# Altium schematic sheet Aquario.SchDoc
size 508 x 193 mm; SheetNumber: 1; SheetTotal: 1
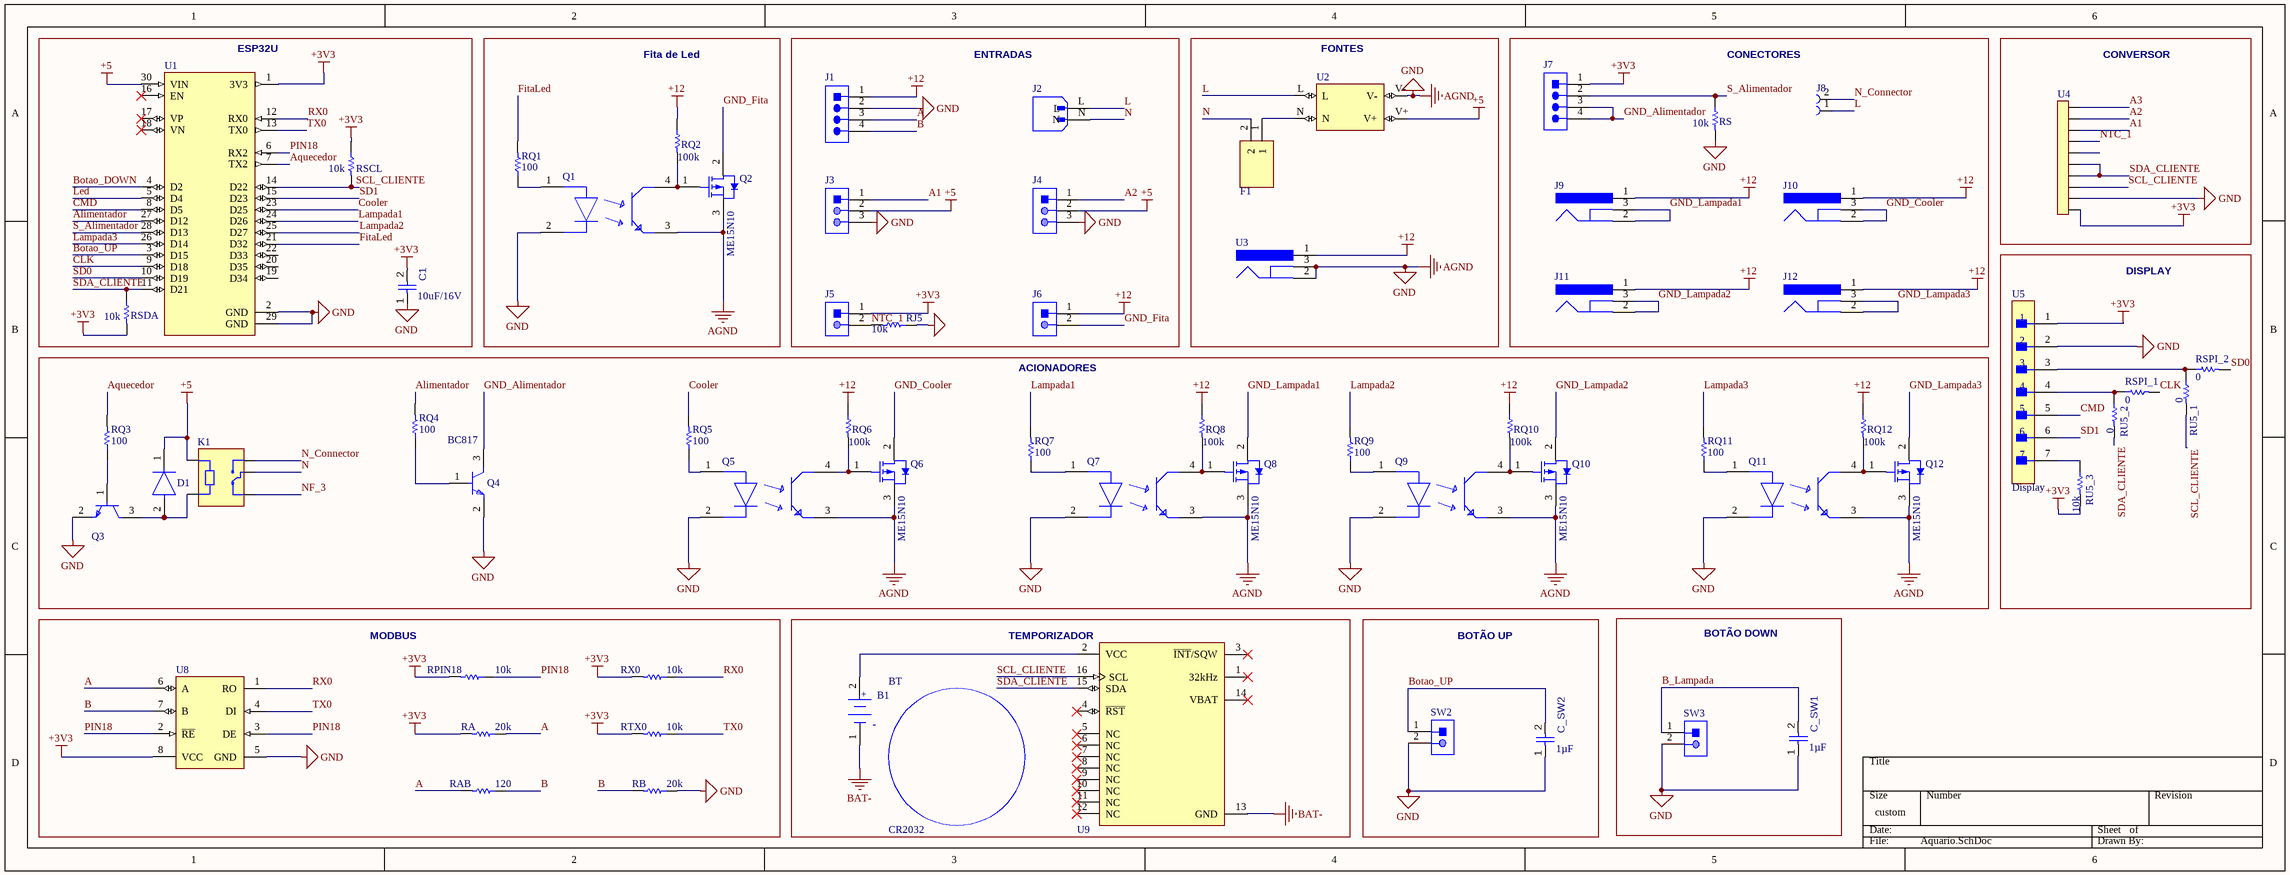
[diagram p0: Aquario.SchDoc]

## Parts
B1  S8421-45R  [FP-S8421-45R-MFG]  (value not drawn)
BT  CR2032  [FP-CR2032-MFG]
C1  10uF/16V  [CAPC2013X145X50ML20T25]
C_SW1  value 1µF  [CAPC2013X145X50ML20T25]  (hidden comment: Capacitor 1 uF +/- 10% 25 V 0805)
C_SW2  value 1µF  [CAPC2013X145X50ML20T25]  (hidden comment: Capacitor 1 uF +/- 10% 25 V 0805)
D1  1N4007 SMD  [FP-1N4007_SMD-IPC_C]  (value not drawn)
F1  0PTF0078P  [0PTF0078P]  (value not drawn)
J1  S4B-XH-A(LF)(SN)  [JST-S4B-XH-A(LF)(SN)_V]  (value not drawn)
J2  RAPC322X  [SWITCHCRAFT_RAPC322X]  (value not drawn)
J3  S3B-XH-A(LF)(SN)  [JST-S3B-XH-A(LF)(SN)_V]  (value not drawn)
J4  S3B-XH-A(LF)(SN)  [JST-S3B-XH-A(LF)(SN)_V]  (value not drawn)
J5  S2B-XH-A(LF)(SN)  [JST-S2B-XH-A(LF)(SN)_V]  (value not drawn)
J6  S2B-XH-A(LF)(SN)  [JST-S2B-XH-A(LF)(SN)_V]  (value not drawn)
J7  S4B-XH-A(LF)(SN)  [JST-S4B-XH-A(LF)(SN)_V]  (value not drawn)
J8  CON2POS  [CON2POS-Footprint-1]  (value not drawn)
J9  PJ-002A  [CUI-PJ-002A_V]  (value not drawn)
J10  PJ-002A  [CUI-PJ-002A_V]  (value not drawn)
J11  PJ-002A  [CUI-PJ-002A_V]  (value not drawn)
J12  PJ-002A  [CUI-PJ-002A_V]  (value not drawn)
K1  SRD-05VDC-SL-C  [RELAY_SRD-05VDC-SL-C]  (value not drawn)
Q1  PC817X4NIP0F  [FP-PC817X4NIP0F-MFG]  (value not drawn)
Q2  ME15N10  [INF-PG-TO252-3-1_L]
Q3  BC817-40,215  [FP-SOT23-MFG]  (value not drawn)
Q4  BC817  [FP-SOT23-MFG]
Q5  PC817X4NIP0F  [FP-PC817X4NIP0F-MFG]  (value not drawn)
Q6  ME15N10  [INF-PG-TO252-3-1_L]
Q7  PC817X4NIP0F  [FP-PC817X4NIP0F-MFG]  (value not drawn)
Q8  ME15N10  [INF-PG-TO252-3-1_L]
Q9  PC817X4NIP0F  [FP-PC817X4NIP0F-MFG]  (value not drawn)
Q10  ME15N10  [INF-PG-TO252-3-1_L]
Q11  PC817X4NIP0F  [FP-PC817X4NIP0F-MFG]  (value not drawn)
Q12  ME15N10  [INF-PG-TO252-3-1_L]
RA  20k  [RESC2013X50X30LL20T20]
RAB  120  [RESC2013X50X30LL20T20]
RB  20k  [RESC2013X50X30LL20T20]
RJ5  10k  [RESC2013X50X30LL20T20]
RPIN18  10k  [RESC2013X50X30LL20T20]
RQ1  100  [RESC2013X50X30LL20T20]
RQ2  100k  [RESC2013X50X30LL20T20]
RQ3  100  [RESC2013X50X30LL20T20]
RQ4  100  [RESC2013X50X30LL20T20]
RQ5  100  [RESC2013X50X30LL20T20]
RQ6  100k  [RESC2013X50X30LL20T20]
RQ7  100  [RESC2013X50X30LL20T20]
RQ8  100k  [RESC2013X50X30LL20T20]
RQ9  100  [RESC2013X50X30LL20T20]
RQ10  100k  [RESC2013X50X30LL20T20]
RQ11  100  [RESC2013X50X30LL20T20]
RQ12  100k  [RESC2013X50X30LL20T20]
RS  10k  [RESC2013X50X30LL20T20]
RSCL  10k  [RESC2013X50X30LL20T20]
RSDA  10k  [RESC2013X50X30LL20T20]
RSPI_1  0  [RESC2013X50X30LL20T20]
RSPI_2  0  [RESC2013X50X30LL20T20]
RTX0  10k  [RESC2013X50X30LL20T20]
RU5_1  0  [RESC2013X50X30LL20T20]
RU5_2  0  [RESC2013X50X30LL20T20]
RU5_3  10k  [RESC2013X50X30LL20T20]
RX0  10k  [RESC2013X50X30LL20T20]
SW2  S2B-XH-A(LF)(SN)  [JST-S2B-XH-A(LF)(SN)_V]  (value not drawn)
SW3  S2B-XH-A(LF)(SN)  [JST-S2B-XH-A(LF)(SN)_V]  (value not drawn)
U1  ESP32-DEVKIT-V1  [MODULE_ESP32_DEVKIT_V1]  (value not drawn)
U2  HLK-5VFonte  [HLK-5VFonte-Footprint-1]  (value not drawn)
U3  PJ-002A  [CUI-PJ-002A_V]  (value not drawn)
U4  ADS1115  [CON10]  (value not drawn)
U5  Display  [FP-B7B-XH-A_LF_SN-MFG]
U8  MAX485CSA+  [MAXM-MAX485CSA+-8_M]  (value not drawn)
U9  DS3231SN#T&R  [FP-W16-H2-MFG]  (value not drawn)

## Blocks framed on the sheet
ESP32U: C1 RSCL RSDA U1
Fita de Led: Q1 Q2 RQ1 RQ2
ENTRADAS: J1-J6 RJ5
FONTES: F1 U2 U3
CONECTORES: J7-J12 RS
CONVERSOR: U4
DISPLAY: RSPI_1 RSPI_2 RU5_1-RU5_3 U5
ACIONADORES: D1 K1 Q3-Q12 RQ3-RQ12
MODBUS: RA RAB RB RPIN18 RTX0 RX0 U8
TEMPORIZADOR: B1 BT U9
BOTÃO UP: C_SW2 SW2
BOTÃO DOWN: C_SW1 SW3

## Nets
+3V3: C1.2 J5.1 J7.1 RA.2 RPIN18.2 RSCL.1 RSDA.2 RTX0.2 RU5_3.2 RX0.2 U1.1(3V3) U4.10 U5.1 U8.8(VCC)
+5: D1.1(C) J3.2 J4.2 K1.A1 U1.30(VIN) U2.V+
+12: J1.1 J6.1 J9.1 J10.1 J11.1 J12.1 RQ2.1 RQ6.1 RQ8.1 RQ10.1 RQ12.1 U3.1
AGND: C1.1 C_SW1.1 C_SW2.1 J1.2 J3.3 J4.3 Q1.2(C) Q1.3(E) Q2.3(SOURCE) Q3.2(E) Q4.2(E) Q5.2(C) Q5.3(E) Q6.3(SOURCE) Q7.2(C) Q7.3(E) Q8.3(SOURCE) Q9.2(C) Q9.3(E) Q10.3(SOURCE) Q11.2(C) Q11.3(E) Q12.3(SOURCE) RB.1 RJ5.1 RS.2 SW2.2 SW3.2 U1.2(GND) U1.29(GND) U2.V- U3.2 U3.3 U4.9 U5.2 U8.5(GND)  [also labelled GND]
BAT-: B1.1(C) U9.13(GND)
A: J1.3 RA.1 RAB.2 U8.6(A)
A1: J3.1 U4.3
A2: J4.1 U4.2
A3: U4.1
Alimentador: RQ4.2 U1.27(D12)
Aquecedor: RQ3.2 U1.7(TX2)
B: J1.4 RAB.1 RB.2 U8.7(B)
B_Lampada: C_SW1.2 SW3.1
Botao_DOWN: U1.4(D2)
Botao_UP: C_SW2.2 SW2.1 U1.3(D15)
CLK: RSPI_1.2 U1.9(D18)
CMD: U1.8(D5) U5.5
Cooler: RQ5.2 U1.23(D25)
FitaLed: RQ1.2 U1.21(D32)
GND_Alimentador: J7.3 J7.4 Q4.3(C)
GND_Cooler: J10.2 J10.3 Q6.2(DRAIN)
GND_Fita: J6.2 Q2.2(DRAIN)
GND_Lampada1: J9.2 J9.3 Q8.2(DRAIN)
GND_Lampada2: J11.2 J11.3 Q10.2(DRAIN)
GND_Lampada3: J12.2 J12.3 Q12.2(DRAIN)
L: J2.L J8.1 U2.L
Lampada1: RQ7.2 U1.24(D26)
Lampada2: RQ9.2 U1.25(D27)
Lampada3: RQ11.2 U1.26(D14)
Led: U1.5(D4)
N: F1.2 J2.N K1.COM
N_Connector: J8.2 K1.NO
NF_3: K1.NC
NTC_1: J5.2 RJ5.2 U4.4
PIN18: RPIN18.1 U1.6(RX2) U8.2(~{RE}) U8.3(DE)
RX0: RX0.1 U1.12(RX0) U8.1(RO)
S_Alimentador: J7.2 RS.1 U1.28(D13)
SCL_CLIENTE: RSCL.2 RU5_1.2 U1.14(D22) U4.8 U9.16(SCL)
SD0: RSPI_2.2 U1.10(D19)
SD1: U1.15(D23) U5.6
SDA_CLIENTE: RSDA.1 RU5_2.2 U1.11(D21) U4.6 U4.7 U9.15(SDA)
TX0: RTX0.1 U1.13(TX0) U8.4(DI)
NetB1_2: B1.2(A) U9.2(VCC)
NetD1_2: D1.2(A) K1.A2 Q3.3(C)
NetF1_1: F1.1 U2.N
NetQ1_1: Q1.1(A) RQ1.1
NetQ1_4: Q1.4(C) Q2.1(GATE) RQ2.2
NetQ3_1: Q3.1(B) RQ3.1
NetQ4_1: Q4.1(B) RQ4.1
NetQ5_1: Q5.1(A) RQ5.1
NetQ5_4: Q5.4(C) Q6.1(GATE) RQ6.2
NetQ7_1: Q7.1(A) RQ7.1
NetQ7_4: Q7.4(C) Q8.1(GATE) RQ8.2
NetQ9_1: Q9.1(A) RQ9.1
NetQ9_4: Q9.4(C) Q10.1(GATE) RQ10.2
NetQ11_1: Q11.1(A) RQ11.1
NetQ11_4: Q11.4(C) Q12.1(GATE) RQ12.2
NetRSPI_1_1: RSPI_1.1 RU5_2.1 U5.4
NetRSPI_2_1: RSPI_2.1 RU5_1.1 U5.3
NetRU5_3_1: RU5_3.1 U5.7

Not connected (* = marked no-connect by the designer): U1 16(EN)* 17(VP)* 18(VN)* 19(D34) 20(D35) 22(D33); U4 5; U9 1(32kHz)* 3(~{INT}/SQW)* 4(~{RST})* 5(NC)* 6(NC)* 7(NC)* 8(NC)* 9(NC)* 10(NC)* 11(NC)* 12(NC)* 14(VBAT)*

## Notes on the sheet
- (in symbol CMP-2000-07028-3) +; -

## Library data of the parts
B1 = CMP-2000-07028-3: BATTERY HOLDER COIN 20MM SMD; Number of Cells: 1; Min Operating Temperature: -40°C; Packaging: Tape and Reel; Max Operating Temperature: 105°C; Number of Batteries: 1; Package Quantity: 500; Material: Polyphenylene; Case/Package: SMD/SMT; Mount: Surface Mount; REACH SVHC: No SVHC; Contact Plating: Bronze; Termination: SMD/SMT
BT = CMP-05417-000003-1: BATTERY LITHIUM 3V COIN 20MM; Manufacturer: Panasonic; ComponentLink2URL: https://upverter.com/datasheet/5ee6469450a36cf26ddc1e0271adf06b3d83bec7.pdf; Device Class L3: unset; Device Class L1: Passive Components; Temperature Range Low: -30°C; Package: CR2032; Mouser Description: Battery; Lithium High Energy; 3 VoltS; 230 MAH; Coin Cell; ComponentLink2Description: Datasheet; Device Class L2: unset; Manufacturer Part Number: CR2032; Octopart: https://octopart.com/cr2032-panasonic-39385932; Temperature Range High: +60°C; Temperature: -30°C to +60°C; Automotive: No; Category: Batt; Height: 3.2mm
C1 = CMP-001-00010-6: Chip Capacitor, 1 uF, +/-10%, 25 V, 0805 (2012 Metric); Capacitor Type: Ceramic; Voltage Rating: 25V; Tolerance: 10%; Value: 10uF/16V; RoHS Compliant: True; Pins: 2; Mounting Technology: SM; Max Operating Temperature: 125°C; Min Operating Temperature: -55°C; Case/Package: 0805
C_SW1 C_SW2 = CMP-001-00010-6: Chip Capacitor, 1 uF, +/-10%, 25 V, 0805 (2012 Metric); Capacitor Type: Ceramic; Voltage Rating: 25V; RoHS Compliant: True; Pins: 2; Mounting Technology: SM; Max Operating Temperature: 125°C; Min Operating Temperature: -55°C; Tolerance: 10%; Case/Package: 0805
D1 = CMP-12389-000001-1: Rectifier, 1Kv, 1A, Do-214Ac Rohs Compliant: Yes
F1 = 0PTF0078P: Undefined or Miscellaneous; Manufacturer_Name: LITTELFUSE; Datasheet Link: https://media.digikey.com/pdf/Data%20Sheets/Littelfuse%20PDFs/PTF075_77_78.pdf; Height: 11.5mm; Manufacturer_Part_Number: 0PTF0078P; Mouser Part Number: 576-0PTF0078P; Mouser Price/Stock: https://www.mouser.co.uk/ProductDetail/Littelfuse/0PTF0078P?qs=Co4VkB5J4%2Fsczy6gG8s%2FsA%3D%3D; Arrow Part Number: 0PTF0078P; Arrow Price/Stock: null?region=nac
J1 J7 = CMP-002-00034-2: Male Header, Pitch 2.5 mm, 1 x 4 Position, Height 6.1 mm, Tail Length 3.4 mm, -25 to 85 degC, RoHS, Bulk; Manufacturer: JST; Manufacturer URL: http://www.jst.com/home2.html; RoHS Compliant: Unknown; Gender: Male; Min Operating Temperature: -25°C; Datasheet URL: http://www.jst-mfg.com/product/pdf/eng/eXH.pdf; Case/Package: S4B-XH-A(LF)(SN); Datasheet Version: May-16; Mounting Technology: TH; Package Reference: S4B-XH-A(LF)(SN); Max Operating Temperature: 85°C; Package Description: XH Series Disconnectable Crimp Style Connector, Pitch 2.5 mm, 1 x 4 Position, Height 6.1 mm, Tail Length 3.4 mm; Connector Type: Header
J2 = RAPC322X: Power Entry Connector Receptacle, Male Pins IEC 320-C8, Non-Polarized Panel Mount, Snap-In; Through Hole, Right Angle; MF: Switchcraft Inc.; Price: None; Package: None; Purchase-URL: https://pricing.snapeda.com/search/part/RAPC322X/?ref=eda; Availability: In Stock; SnapEDA_Link: https://www.snapeda.com/parts/RAPC322X/Switchcraft+Inc./view-part/?ref=snap; Value: *; MP: RAPC322X; Check_prices: https://www.snapeda.com/parts/RAPC322X/Switchcraft+Inc./view-part/?ref=eda
J3 J4 = CMP-002-00033-2: Male Header, Pitch 2.5 mm, 1 x 3 Position, Height 6.1 mm, Tail Length 3.4 mm, -25 to 85 degC, RoHS, Bulk; Manufacturer: JST; Package Description: Male Header, Pitch 2.5 mm, 1 x 3 Position, Height 6.1 mm, Tail Length 3.4 mm; Manufacturer URL: http://www.jst.com/home2.html; Datasheet URL: http://www.jst-mfg.com/product/pdf/eng/eXH.pdf; RoHS Compliant: Unknown; Connector Type: Header; Package Reference: S3B-XH-A(LF)(SN); Gender: Male; Case/Package: S3B-XH-A(LF)(SN); Mounting Technology: TH; Max Operating Temperature: 85°C; Min Operating Temperature: -25°C; Datasheet Version: May-16
J5 J6 SW2 SW3 = CMP-002-00032-2: Male Header, Pitch 2.5 mm, 1 x 2 Position, Height 6.1 mm, Tail Length 3.4 mm, -25 to 85 degC, RoHS, Bulk; Manufacturer: JST; Case/Package: S2B-XH-A(LF)(SN); Package Description: XH Series Disconnectable Crimp Style Connector, Pitch 2.5 mm, 1 x 2 Position, Height 6.1 mm, Tail Length 3.4 mm; Manufacturer URL: http://www.jst.com/home2.html; Datasheet URL: http://www.jst-mfg.com/product/pdf/eng/eXH.pdf; Connector Type: Header; Package Reference: S2B-XH-A(LF)(SN); Mounting Technology: TH; Max Operating Temperature: 85°C; Min Operating Temperature: -25°C; Datasheet Version: May-16; Gender: Male; RoHS Compliant: Unknown
J8 = CMP-002-00071-1: Conector Borne
J9-J12 U3 = CMP-2000-06895-2: Through Hole Right Angle DC Power Jack, 2.5 A, 2 mm Center Pin, 3 Position, -25 to 85 degC, RoHS, Bulk; Manufacturer: CUIInc.; Brand: CUI; Inside Contact Diameter: 2mm; Voltage Rating: 24V; Outside Contact Diameter: 6.5mm; Current Rating: 2.5A; Insulation Resistance: 50MOhms; Contact Gender: Male; Connector Type: DCPowerJack; Datasheet Version: Rev. 1.03, 04/2016; Housing Material: PolybutyleneTerephthalate(PBT); Operating Temperature Range: -25Cto+85C; Termination Style: ThroughHole; Product Category: DCPowerConnectors; Mounting Technology: ThroughHole; Mounting Style: ThroughHole; Factory Pack Quantity: 500; Contact Plating: Nickel; Package Reference: PJ-002A; Mounting Angle: Right; Package Description: 3-Pin Through Hole Device, Body 14.4 x 9 mm, Height 11 mm; Flammability Rating: UL94V-0; Manufacturer URL: http://www.cui.com/; Product: Jacks; Contact Material: Copper; Datasheet URL: http://www.cui.com/product/resource/pj-002a.pdf; RoHS: True
K1 = SRD-05VDC-SL-C: 5V Trigger Relay Module For Arduino And Raspberry Pi 5V Trigger Relay Module For Arduino And Raspberry Pi; MF: Songle Relay; Value: *; Price: None; Package: NON STANDARD-5 Songle Relay; Availability: Not in stock; Check_prices: https://www.snapeda.com/parts/SRD-05VDC-SL-C/Songle+Relay/view-part/?ref=eda; MP: SRD-05VDC-SL-C; SnapEDA_Link: https://www.snapeda.com/parts/SRD-05VDC-SL-C/Songle+Relay/view-part/?ref=snap
Q1 Q5 Q7 Q9 Q11 = CMP-65434-000001-1: OPTOISOLATOR 5KV TRANS 4SMD; Manufacturer: Sharp; Collector Emitter Voltage: 80V; Standoff Height: 0.1mm; Power Dissipation: 200mW; Min Current Transfer Ratio: 50%; Reverse Voltage: 6V; Forward Current: 20mA; Forward Voltage: 1.2V; Max Current Transfer Ratio: 600%; Isolation Voltage: 5kVrms; Mouser Description: Transistor Output Optocouplers Photocoupler 300-600% CRT; RoHS: TRUE; ComponentLink2URL: https://www.sharpsde.com/fileadmin/products/Optoelectronics/Isolation%20Devices/Specs%20Photocoupler/PC817XxNIP0F_17Jun08_Spec_ED-04P129A.pdf; Lead Free: Yes; Device Class L1: Optoelectronics; ComponentLink2Description: Datasheet; Device Class L2: Optocouplers; Temperature: -30°C to +100°C; Temperature Range Low: -30°C; Automotive: No; Temperature Range High: +100°C; Octopart: https://octopart.com/pc817x4nip0f-sharp-20650453; Height: 4.6mm; Digikey Description: OPTOISOLATOR 5KV TRANS 4SMD; Category: Trans; Device Class L3: unset; Package: PC817X4NIP0F; Manufacturer Part Number: PC817X4NIP0F; Emiiter Collector Voltage: 6V
Q2 Q6 Q8 Q10 Q12 = CMP-1099-00054-1: P-Channel OptiMOS P3 Power-Transistor, -30 V VDS, -70 A ID, -55 to 175 degC, PG-TO252-3-1, Reel, Green; Manufacturer: Infineon; PartNumber: IPD042P03L3 G; VDS (max): -30Â V; Green: TRUE; ID (max): -70Â A; Rth: 1Â K/W; RDS (on) (max): 4.2Â mOhm; QG: 131Â nC; VGS(th) (max): -1Â V; RDS (on) (max) (@4.5V): 6.8Â mOhm; VGS(th) (min): -2Â V; Pto t (max): 150Â W; IDpuls (max): -280Â A; Packing: Reel; DatasheetVersion: Rev. 2.0; RthJC (max): 1Â K/W; ComponentLink2URL: http://www.infineon.com/dgdl/IPD042P03L3+G_2+0.pdf?folderId=db3a304314dca38901154a72e3951a65&fileId=db3a30431d8a6b3c011d90c8c6e60425; ComponentLink3URL: http://www.infineon.com/dgdl/TLE42744_DS_11.pdf?folderId=db3a304318f3fe290118f5a433570040&fileId=db3a304327b897500128012ccafe37d2&sId=db3a30443d67b5ca013d83f7c0ea327b; PackageDescription: 3-Pin Plastic (Green) Transistor Single Outline Package, 6.5 x 6.12 mm Body, 2.28 mm Pitch; ComponentLink1Description: Manufacturer URL; ComponentLink3Description: Package Specification; PackageReference: PG-TO252-3-1; PackageVersion: Jan-10; ComponentLink2Description: Datasheet; ComponentLink1URL: http://www.infineon.com/; Mounting Technology: Surface Mount
Q3 = CMP-14406-000007-1: TRANS NPN 45V 0.5A SOT23; Manufacturer: Nexperia; Collector Emitter Saturation Voltage: 700mV; Power Dissipation: 250mW; Collector Base Voltage: 50V; Unity Gain Freq: 100MHz; Hfe Max: 600; Rthja Max: 500K/W; Emitter Base Voltage: 5V; Max Collector Current: 500mA; Hfe Testvce: 1V; Automotive Grade: Grade 0; Hfe Min: 250; Max Junction Temp: +150°C; Number Of Npn: 1; Hfe Testic: 100mA; Octopart: https://octopart.com/bc817-40%2C215-nexperia-78739081; Lead Free: Yes; Ipc Land Pattern Name: SOT95P230X100-3; Manufacturer Part Number: BC817-40,215; RoHS: TRUE; Collector Emitter Breakdown Voltage: 45V; Digikey Description: TRANS NPN 45V 0.5A SOT23; ComponentLink2URL: https://assets.nexperia.com/documents/data-sheet/BC817_SER.pdf; Temperature Range High: +150°C; Mouser Description: BC817 Series 45 V 500 mA 250 mW SMT NPN General-Purpose Transistor - SOT-23-; Device Class L3: BJTs; Temperature: to +150°C; Height: 1.1mm; Automotive: Yes; Ambient Temperature Range Low: -65°C; Package: SOT23; Collector Emitter Voltage: 45V; Category: Trans; ComponentLink2Description: Datasheet; Device Class L2: Transistors; Ambient Temperature Range High: +150°C; Number Of Elements: 1; Device Class L1: Discrete Semiconductors; Footprint Url: https://assets.nexperia.com/documents/outline-drawing/SOT23.pdf
Q4 = CMP-14406-000007-1: TRANS NPN 45V 0.5A SOT23; Manufacturer Part Number: BC817-40,215; Manufacturer: Nexperia; Collector Emitter Saturation Voltage: 700mV; Power Dissipation: 250mW; Collector Base Voltage: 50V; Unity Gain Freq: 100MHz; Hfe Max: 600; Rthja Max: 500K/W; Emitter Base Voltage: 5V; Max Collector Current: 500mA; Hfe Testvce: 1V; Automotive Grade: Grade 0; Hfe Min: 250; Max Junction Temp: +150°C; Number Of Npn: 1; Hfe Testic: 100mA; Octopart: https://octopart.com/bc817-40%2C215-nexperia-78739081; Lead Free: Yes; Ipc Land Pattern Name: SOT95P230X100-3; RoHS: TRUE; Collector Emitter Breakdown Voltage: 45V; Digikey Description: TRANS NPN 45V 0.5A SOT23; ComponentLink2URL: https://assets.nexperia.com/documents/data-sheet/BC817_SER.pdf; Temperature Range High: +150°C; Mouser Description: BC817 Series 45 V 500 mA 250 mW SMT NPN General-Purpose Transistor - SOT-23-; Device Class L3: BJTs; Temperature: to +150°C; Height: 1.1mm; Automotive: Yes; Ambient Temperature Range Low: -65°C; Package: SOT23; Collector Emitter Voltage: 45V; Category: Trans; ComponentLink2Description: Datasheet; Device Class L2: Transistors; Ambient Temperature Range High: +150°C; Number Of Elements: 1; Device Class L1: Discrete Semiconductors; Footprint Url: https://assets.nexperia.com/documents/outline-drawing/SOT23.pdf
RA RAB RB RJ5 RPIN18 RQ1-RQ12 RS RSCL RSDA RSPI_1 RSPI_2 RTX0 RU5_1-RU5_3 RX0 = CMP-2001-04896-1: Manufacturer: Vishay Dale; Part Number: CRCW08050000Z0EA
U1 = ESP32-DEVKIT-V1: Dual core, Wi-Fi: 2.4 GHz up to 150 Mbits/s,BLE (Bluetooth Low Energy) and legacy Bluetooth, 32 bits, Up to 240 MHz; Value: *; MP: ESP32-DEVKIT-V1; Availability: Unavailable; Package: None; Price: None
U2 = CMP-001-0001-1
U4 = CONECTOR_10PIN
U5 = CMP-17439-000323-2: CONN HEADER VERT 7POS 2.5MM; Current Rating: 3A; Voltage Rating: 250V; Number of Contacts: 7; Mated Stacking Heights: 9.8mm; Insulation Resistance: 1GR; Contact Resistance: 20mR; Wire/Cable Gauge: 22AWG; Contact Finish - Mating: TIN; Orientation: Straight; REACH SVHC: No SVHC; Max Operating Temperature: 85°C; Housing Color: White; Pitch: 2.5mm; Mount: Through Hole; Packaging: Bulk; Depth: 5.75mm; Series: XH; Min Operating Temperature: -25°C; Length: 19.9mm; Connector Type: Header; Number of Positions: 7; Color: Natural; Max Current Rating: 3A; Lead Pitch: 2.5mm; Termination: Solder; Fastening Type: Detent; Flammability Rating: UL94 V-0; Voltage Rating (AC): 250V; Lead Free: Lead Free; Contact Material: Brass; Max Voltage Rating (AC): 250V; Contact Type: Male Pin; Housing Material: Polyamide; Insulation Color: Natural; Contact Shape: Square; Number of Rows: 1; Contact Plating: Tin; Insulation Material: Nylon
U8 = CMP-2000-05211-1: Low-Power, Slew-Rate-Limited RS-485/RS-422 Transceiver, 4.75 to 5.25 V, 0 to 70 degC, 8-Pin SOIC, RoHS, Tape and Reel; Manufacturer: Maxim; No. of Receivers: 1; Transceiver Type: Differential; Supply Voltage Min: 4.75V; IC Generic Number: 485; IC Temperature Range: Commercial; No. of Pins: 8; Supply Voltage Range: 4.75Vto5.25V; Interface: RS-422/RS-485; Supply Voltage Max: 5.25V; Data Rate: 2.5Mbps; Line / Bus Driver / Receiver / Transceiver Type: CMOSDifferential; Supply Current: 500µA; Interface Type: RS422,RS485; Device Type: Transceiver; Manufacturer URL: http://www.maximintegrated.com/; Operating Temperature Range: 0degCto+70degC; Package / Case: SOIC; Digital IC Case Style: SOIC; Operating Temperature Max: 70degC; Device Marking: MAX485CSA+; Driver Case Style: SOIC; Datasheet Version: Rev. 8, 10/2003; Operating Temperature Min: 0degC; Datasheet URL: https://datasheet.ciiva.com/29306/170071-da-01-en-ic-max485csa-so8-29306144.pdf; Base Number: 485; No. of Drivers: 1; Logic Function Number: 485
U9 = CMP-0254-00375-2: IC RTC CLK/CALENDAR I2C 16-SOIC; Operating Supply Voltage: 3.3V; Max Supply Voltage: 5.5V; Logic Function: Clock; Time Format: HH:MM:SS; Date Format: YY-MM-DD-dd; Min Supply Voltage: 2.3V; Min Operating Temperature: -40°C; Packaging: Tape and Reel; Radiation Hardening: No; Package Quantity: 1000; Case/Package: SOIC; Max Operating Temperature: 85°C; Lead Free: Lead Free; Interface: I2C; Contact Plating: Tin; Number of Pins: 16; Mount: Surface Mount